# Altium schematic sheet LAN_SD.SchDoc
size A4; SheetNumber: 5; SheetTotal: 11
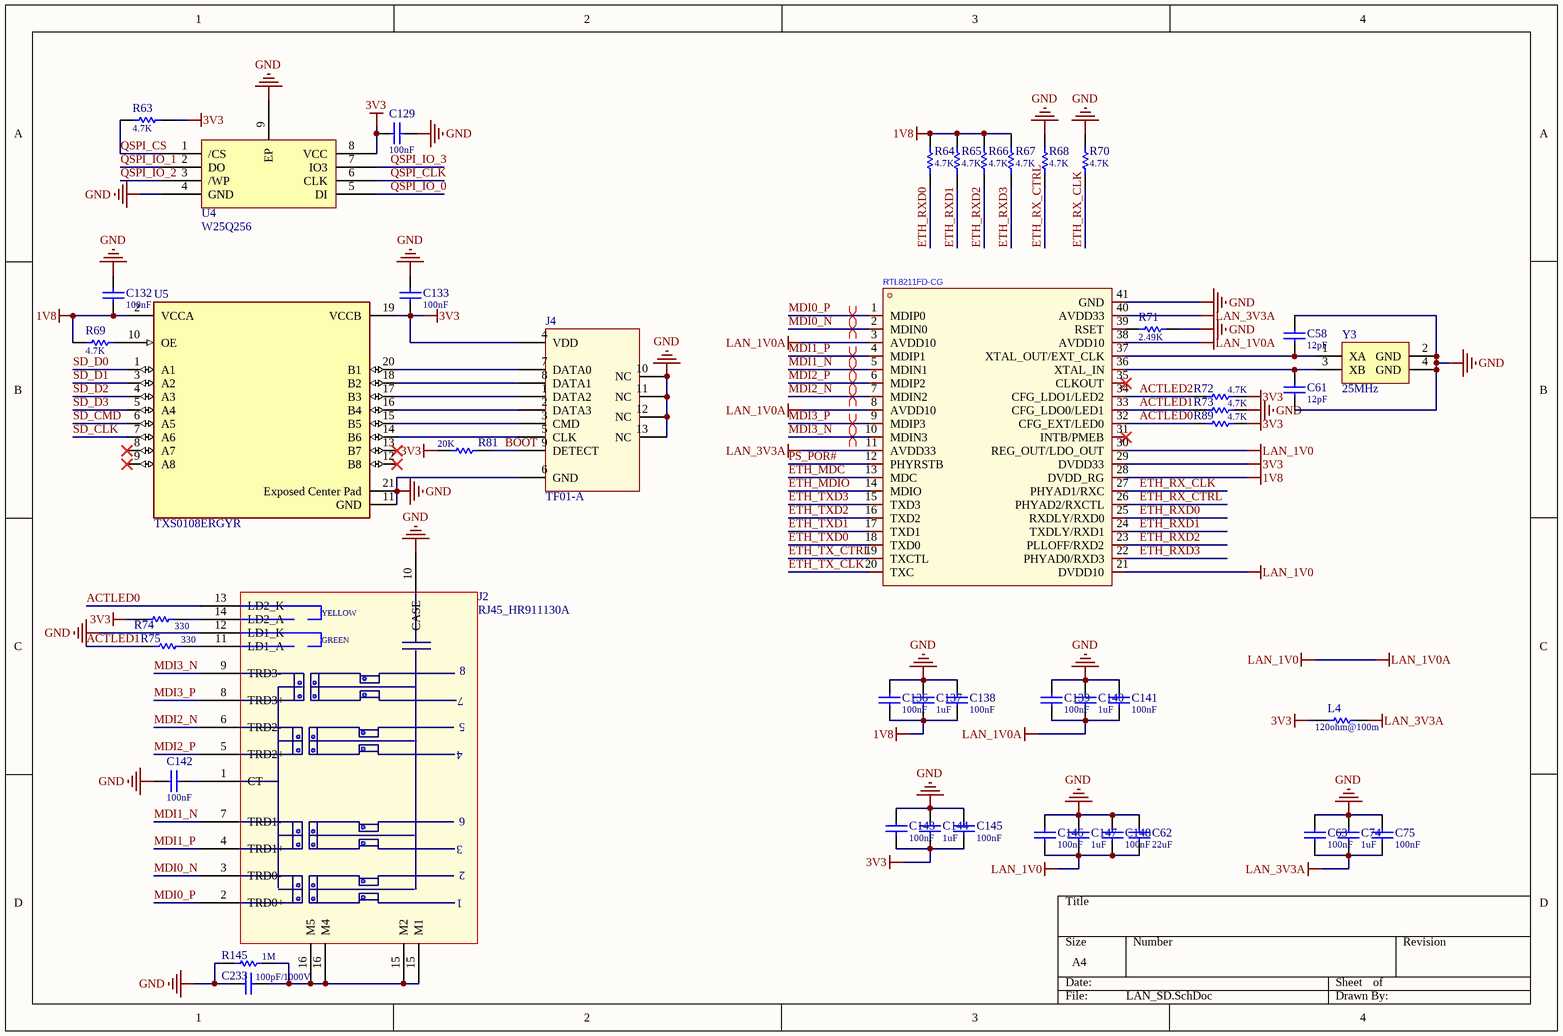
[diagram p0: LAN_SD.SchDoc]

## Parts
C58  value 12pF  [C0402-L]  (hidden comment: Cap-S)
C61  value 12pF  [C0402-L]  (hidden comment: Cap-S)
C62  value 22uF  [C0603-M]  (hidden comment: Cap-S)
C63  value 100nF  [C0402-L]  (hidden comment: Cap-S)
C74  value 1uF  [C0402-L]  (hidden comment: Cap-S)
C75  value 100nF  [C0402-L]  (hidden comment: Cap-S)
C129  value 100nF  [C0402-L]  (hidden comment: Cap-S)
C132  value 100nF  [C0402-L]  (hidden comment: Cap-S)
C133  value 100nF  [C0402-L]  (hidden comment: Cap-S)
C136  value 100nF  [C0402-L]  (hidden comment: Cap-S)
C137  value 1uF  [C0402-L]  (hidden comment: Cap-S)
C138  value 100nF  [C0402-L]  (hidden comment: Cap-S)
C139  value 100nF  [C0402-L]  (hidden comment: Cap-S)
C140  value 1uF  [C0402-L]  (hidden comment: Cap-S)
C141  value 100nF  [C0402-L]  (hidden comment: Cap-S)
C142  value 100nF  [C0603-M]  (hidden comment: Cap-S)
C143  value 100nF  [C0402-L]  (hidden comment: Cap-S)
C144  value 1uF  [C0402-L]  (hidden comment: Cap-S)
C145  value 100nF  [C0402-L]  (hidden comment: Cap-S)
C146  value 100nF  [C0402-L]  (hidden comment: Cap-S)
C147  value 1uF  [C0402-L]  (hidden comment: Cap-S)
C148  value 100nF  [C0402-L]  (hidden comment: Cap-S)
C233  value 100pF/1000V  [C1206-L]  (hidden comment: Cap-S)
J2  RJ45_HR911130A  [RJ45-TH_HR911130A]
J4  TF01-A  [TF-SMD_TF-01A]
L4  value 120ohm@100m  [R0603-L]  (hidden comment: R)
R63  value 4.7K  [R0402-L]  (hidden comment: R)
R64  value 4.7K  [R0402-L]  (hidden comment: R)
R65  value 4.7K  [R0402-L]  (hidden comment: R)
R66  value 4.7K  [R0402-L]  (hidden comment: R)
R67  value 4.7K  [R0402-L]  (hidden comment: R)
R68  value 4.7K  [R0402-L]  (hidden comment: R)
R69  value 4.7K  [R0402-L]  (hidden comment: R)
R70  value 4.7K  [R0402-L]  (hidden comment: R)
R71  value 2.49K  [R0402-L]  (hidden comment: R)
R72  value 4.7K  [R0402-L]  (hidden comment: R)
R73  value 4.7K  [R0402-L]  (hidden comment: R)
R74  value 330  [R0603-M]  (hidden comment: R)
R75  value 330  [R0603-M]  (hidden comment: R)
R81  value 20K  [R0402-L]  (hidden comment: R)
R89  value 4.7K  [R0402-L]  (hidden comment: R)
R145  value 1M  [R1206-L]  (hidden comment: R)
U4  W25Q256  [WPDFN-8_L8.0-W6.0-P1.27-EP-BL]
U5  TXS0108ERGYR  [FP-RGY0020A-MFG]
U6  RTL8211FD-CG  [WQFN-40_L5.0-W5.0-P0.4-BL-EP]
Y3  25MHz  [CRYSTAL-SMD_4P-L2.0-W1.6-BL]

## Nets
1V8: C132.1 C136.2 C137.2 C138.2 R64.1 R65.1 R66.1 R67.1 R69.2 U5.2(VCCA) U6.28(DVDD_RG)
3V3: C129.1 C133.1 C143.2 C144.2 C145.2 J4.4(VDD) L4.1 R63.2 R72.1 R74.1 R81.2 R89.1 U4.8(VCC) U5.19(VCCB) U6.29(DVDD33)
GND: C58.2 C61.1 C62.2 C63.1 C74.1 C75.1 C129.2 C132.2 C133.2 C136.1 C137.1 C138.1 C139.1 C140.1 C141.1 C142.2 C143.1 C144.1 C145.1 C146.1 C147.1 C148.1 C233.2 J2.10(CASE) J2.12(LD1_K) J4.6(GND) J4.10(NC) J4.11(NC) J4.12(NC) J4.13(NC) R68.1 R70.1 R71.2 R73.1 R145.1 U4.4(GND) U4.9(EP) U5.11(GND) U5.21(Exposed_Center_Pad) U6.41(GND) Y3.2(GND) Y3.4(GND)
LAN_1V0: C62.1 C139.2 C140.2 C141.2 C146.2 C147.2 C148.2 U6.3(AVDD10) U6.8(AVDD10) U6.21(DVDD10) U6.30(REG_OUT/LDO_OUT) U6.38(AVDD10)  [also labelled LAN_1V0A]
LAN_3V3A: C63.2 C74.2 C75.2 L4.2 U6.11(AVDD33) U6.40(AVDD33)
ACTLED0: J2.13(LD2_K) R89.2 U6.32(CFG_EXT/LED0)
ACTLED1: R73.2 R75.1 U6.33(CFG_LDO0/LED1)
ACTLED2: R72.2 U6.34(CFG_LDO1/LED2)
BOOT: J4.9(DETECT) R81.1
ETH_MDC: U6.13(MDC)
ETH_MDIO: U6.14(MDIO)
ETH_RX_CLK: R70.2 U6.27(PHYAD1/RXC)
ETH_RX_CTRL: R68.2 U6.26(PHYAD2/RXCTL)
ETH_RXD0: R64.2 U6.25(RXDLY/RXD0)
ETH_RXD1: R65.2 U6.24(TXDLY/RXD1)
ETH_RXD2: R66.2 U6.23(PLLOFF/RXD2)
ETH_RXD3: R67.2 U6.22(PHYAD0/RXD3)
ETH_TX_CLK: U6.20(TXC)
ETH_TX_CTRL: U6.19(TXCTL)
ETH_TXD0: U6.18(TXD0)
ETH_TXD1: U6.17(TXD1)
ETH_TXD2: U6.16(TXD2)
ETH_TXD3: U6.15(TXD3)
MDI0_N: J2.3(TRD0-) U6.2(MDIN0)
MDI0_P: J2.2(TRD0+) U6.1(MDIP0)
MDI1_N: J2.7(TRD1-) U6.5(MDIN1)
MDI1_P: J2.4(TRD1+) U6.4(MDIP1)
MDI2_N: J2.6(TRD2-) U6.7(MDIN2)
MDI2_P: J2.5(TRD2+) U6.6(MDIP2)
MDI3_N: J2.9(TRD3-) U6.10(MDIN3)
MDI3_P: J2.8(TRD3+) U6.9(MDIP3)
PS_POR#: U6.12(PHYRSTB)
QSPI_CLK: U4.6(CLK)
QSPI_CS: R63.1 U4.1(/CS)
QSPI_IO_0: U4.5(DI)
QSPI_IO_1: U4.2(DO)
QSPI_IO_2: U4.3(/WP)
QSPI_IO_3: U4.7(IO3)
SD_CLK: U5.7(A6)
SD_CMD: U5.6(A5)
SD_D0: U5.1(A1)
SD_D1: U5.3(A2)
SD_D2: U5.4(A3)
SD_D3: U5.5(A4)
NetC58_1: C58.1 U6.37(XTAL_OUT/EXT_CLK) Y3.1(XA)
NetC61_2: C61.2 U6.36(XTAL_IN) Y3.3(XB)
NetC142_1: C142.1 J2.1(CT)
NetC233_1: C233.1 J2.15(M2) J2.16(M5) R145.2
NetJ2_11: J2.11(LD1_A) R75.2
NetJ2_14: J2.14(LD2_A) R74.2
NetJ4_1: J4.1(DATA2) U5.17(B3)
NetJ4_2: J4.2(DATA3) U5.16(B4)
NetJ4_3: J4.3(CMD) U5.15(B5)
NetJ4_5: J4.5(CLK) U5.14(B6)
NetJ4_7: J4.7(DATA0) U5.20(B1)
NetJ4_8: J4.8(DATA1) U5.18(B2)
NetR69_1: R69.1 U5.10(OE)
NetR71_1: R71.1 U6.39(RSET)

Not connected (* = marked no-connect by the designer): U5 8(A7)* 9(A8)* 12(B8)* 13(B7)*; U6 31(INTB/PMEB)* 35(CLKOUT)*

## Layout directives
differential pair: MDI0_N, MDI0_P, MDI1_N, MDI1_P, MDI2_N, MDI2_P, MDI3_N, MDI3_P

## Notes on the sheet
- (in symbol RJ45_HR911130A) YELLOW; GREEN

## Library data of the parts
C58 C61-C63 C74 C75 C129 C132 C133 C136-C148 C233 = Cap-S: 贴片瓷片电容
J4 = TF01-A: TF卡卡槽
L4 R63-R75 R81 R89 R145 = Res: 贴片电阻
U5 = CMP-04899-000066-1: IC TRNSLTR BIDIRECTIONAL 20VQFN; Propagation Delay: 4.8ns; Number of Channels: 8; High Level Output Current: -50mA; Min Supply Voltage: 1.2V; Data Rate: 60Mbps; Quiescent Current: 3uA; Logic Function: Translator; Low Level Output Current: 50mA; Max Supply Voltage: 5.5V; Output Type: Voltage; Turn-On Delay Time: 312ns; Packaging: Tape and Reel; Min Operating Temperature: -40°C; Package Quantity: 1; Case/Package: VQFN; Mount: Surface Mount; Number of Pins: 20; Radiation Hardening: No; Series: -; RoHS Compliant: Yes; REACH SVHC: No SVHC; Max Operating Temperature: 85°C; Number of Bits: 8; Lead Free: Lead Free; Weight: 0.001517oz; Number of Inputs: 8
U6 = RTL8211F-CG: Manufacturer: REALTEK(瑞昱); Add into BOM: yes; Number of Channels: 4; Interface: RGMII; Supply Voltage: 1.8V；2.5V；3.3V；1.5V; Symbol: RTL8211F-CG; Device: RTL8211F-CG; LCSC Part Name: 集成10/100/1000M以太网精密收发器; Supplier Part: C187932; Manufacturer Part: RTL8211F-CG; Supplier Footprint: WQFN-40-EP(5x5); JLCPCB Part Class: Extended Part; Datasheet: https://atta.szlcsc.com/upload/public/pdf/source/20190902/C187932_1913F3711F05FE1324DF2946D70D648D.pdf; Supplier: LCSC; Convert to PCB: yes; Application Function: -
Y3 = XTAL-PASS